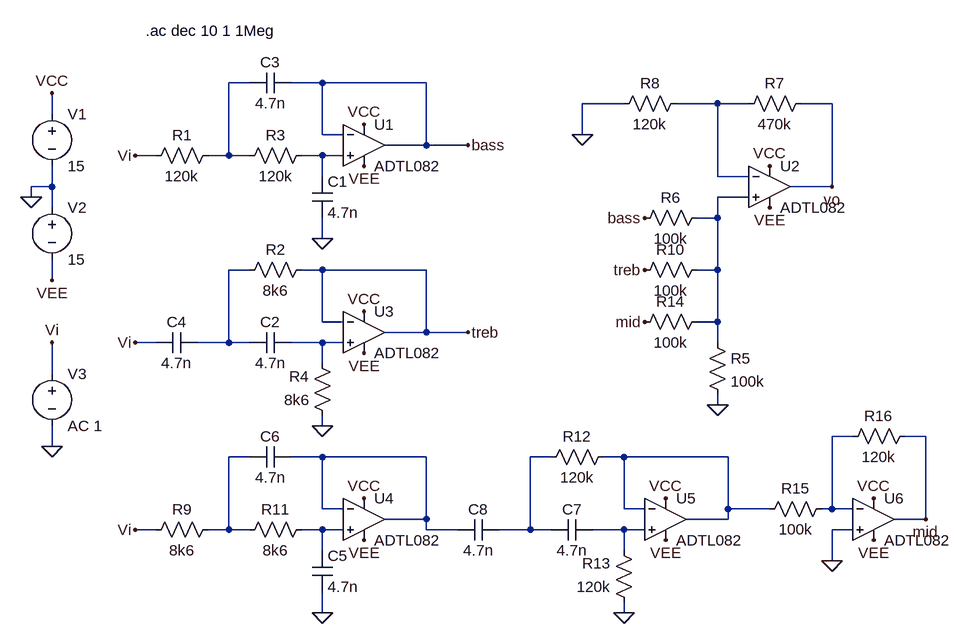
[diagram p0: schematic eq_sk.asc]
eq_sk.asc, the LTspice schematic file:
Version 4.1
SHEET 1 1384 1348
WIRE 192 16 160 16
WIRE 304 16 256 16
WIRE 464 16 304 16
WIRE 768 48 704 48
WIRE 912 48 848 48
WIRE 960 48 912 48
WIRE 1088 48 1040 48
WIRE -112 64 -112 32
WIRE 304 96 304 16
WIRE 336 96 304 96
WIRE 704 96 704 48
WIRE 464 112 464 16
WIRE 464 112 400 112
WIRE 528 112 464 112
WIRE 48 128 16 128
WIRE 160 128 160 16
WIRE 160 128 128 128
WIRE 192 128 160 128
WIRE 304 128 272 128
WIRE 336 128 304 128
WIRE 304 160 304 128
WIRE 912 160 912 48
WIRE 960 160 912 160
WIRE -112 176 -112 144
WIRE -112 176 -144 176
WIRE 1088 176 1088 48
WIRE 1088 176 1024 176
WIRE -144 192 -144 176
WIRE 960 192 912 192
WIRE -112 208 -112 176
WIRE 912 224 912 192
WIRE 912 224 880 224
WIRE 304 256 304 224
WIRE 192 304 160 304
WIRE 304 304 272 304
WIRE 464 304 304 304
WIRE 912 304 912 224
WIRE 912 304 880 304
WIRE -112 320 -112 288
WIRE 304 384 304 304
WIRE 336 384 304 384
WIRE 912 384 912 304
WIRE 912 384 880 384
WIRE 464 400 464 304
WIRE 464 400 400 400
WIRE 528 400 464 400
WIRE 48 416 16 416
WIRE 160 416 160 304
WIRE 160 416 112 416
WIRE 192 416 160 416
WIRE 304 416 256 416
WIRE 336 416 304 416
WIRE 912 416 912 384
WIRE 304 448 304 416
WIRE -112 464 -112 416
WIRE 912 512 912 496
WIRE 304 544 304 528
WIRE 1120 560 1088 560
WIRE 1232 560 1200 560
WIRE -112 576 -112 544
WIRE 192 592 160 592
WIRE 304 592 256 592
WIRE 464 592 304 592
WIRE 656 592 624 592
WIRE 768 592 736 592
WIRE 928 592 768 592
WIRE 304 672 304 592
WIRE 336 672 304 672
WIRE 768 672 768 592
WIRE 800 672 768 672
WIRE 928 672 928 592
WIRE 992 672 928 672
WIRE 1088 672 1088 560
WIRE 1088 672 1072 672
WIRE 1120 672 1088 672
WIRE 464 688 464 592
WIRE 464 688 400 688
WIRE 928 688 928 672
WIRE 928 688 864 688
WIRE 1232 688 1232 560
WIRE 1232 688 1184 688
WIRE 48 704 16 704
WIRE 160 704 160 592
WIRE 160 704 128 704
WIRE 192 704 160 704
WIRE 304 704 272 704
WIRE 336 704 304 704
WIRE 464 704 464 688
WIRE 512 704 464 704
WIRE 624 704 624 592
WIRE 624 704 576 704
WIRE 656 704 624 704
WIRE 768 704 720 704
WIRE 800 704 768 704
WIRE 1120 704 1088 704
WIRE 304 736 304 704
WIRE 768 736 768 704
WIRE 1088 752 1088 704
WIRE 304 832 304 800
WIRE 768 832 768 816
FLAG -112 320 VEE
FLAG -112 32 VCC
FLAG -144 192 0
FLAG -112 576 0
FLAG -112 416 Vi
FLAG 992 144 VCC
FLAG 992 208 VEE
FLAG 912 512 0
FLAG 800 224 bass
FLAG 800 304 treb
FLAG 1088 176 vo
FLAG 1232 688 mid
FLAG 800 384 mid
FLAG 704 96 0
FLAG 1152 656 VCC
FLAG 1152 720 VEE
FLAG 1088 752 0
FLAG 368 80 VCC
FLAG 368 144 VEE
FLAG 304 256 0
FLAG 528 112 bass
FLAG 16 128 Vi
FLAG 368 368 VCC
FLAG 368 432 VEE
FLAG 304 544 0
FLAG 528 400 treb
FLAG 16 416 Vi
FLAG 368 656 VCC
FLAG 368 720 VEE
FLAG 304 832 0
FLAG 16 704 Vi
FLAG 832 656 VCC
FLAG 832 720 VEE
FLAG 768 832 0
SYMBOL voltage -112 48 R0
WINDOW 123 0 0 Left 0
WINDOW 39 0 0 Left 0
SYMATTR InstName V1
SYMATTR Value 15
SYMBOL voltage -112 192 R0
WINDOW 123 0 0 Left 0
WINDOW 39 0 0 Left 0
SYMATTR InstName V2
SYMATTR Value 15
SYMBOL voltage -112 448 R0
WINDOW 123 0 0 Left 0
WINDOW 39 0 0 Left 0
SYMATTR InstName V3
SYMATTR Value AC 1
SYMBOL OpAmps\\ADTL082 992 112 R0
SYMATTR InstName U2
SYMBOL res 896 400 R0
SYMATTR InstName R5
SYMATTR Value 100k
SYMBOL res 896 208 R90
WINDOW 0 0 56 VBottom 2
WINDOW 3 32 56 VTop 2
SYMATTR InstName R6
SYMATTR Value 100k
SYMBOL res 896 288 R90
WINDOW 0 0 56 VBottom 2
WINDOW 3 32 56 VTop 2
SYMATTR InstName R10
SYMATTR Value 100k
SYMBOL res 896 368 R90
WINDOW 0 0 56 VBottom 2
WINDOW 3 32 56 VTop 2
SYMATTR InstName R14
SYMATTR Value 100k
SYMBOL res 1056 32 R90
WINDOW 0 0 56 VBottom 2
WINDOW 3 32 56 VTop 2
SYMATTR InstName R7
SYMATTR Value 470k
SYMBOL res 864 32 R90
WINDOW 0 0 56 VBottom 2
WINDOW 3 32 56 VTop 2
SYMATTR InstName R8
SYMATTR Value 120k
SYMBOL OpAmps\\ADTL082 1152 624 R0
SYMATTR InstName U6
SYMBOL res 1088 656 R90
WINDOW 0 0 56 VBottom 2
WINDOW 3 32 56 VTop 2
SYMATTR InstName R15
SYMATTR Value 100k
SYMBOL res 1216 544 R90
WINDOW 0 0 56 VBottom 2
WINDOW 3 32 56 VTop 2
SYMATTR InstName R16
SYMATTR Value 120k
SYMBOL OpAmps\\ADTL082 368 48 R0
SYMATTR InstName U1
SYMBOL res 144 112 R90
WINDOW 0 0 56 VBottom 2
WINDOW 3 32 56 VTop 2
SYMATTR InstName R1
SYMATTR Value 120k
SYMBOL res 288 112 R90
WINDOW 0 0 56 VBottom 2
WINDOW 3 32 56 VTop 2
SYMATTR InstName R3
SYMATTR Value 120k
SYMBOL cap 288 160 R0
SYMATTR InstName C1
SYMATTR Value 4.7n
SYMBOL cap 256 0 R90
WINDOW 0 0 32 VBottom 2
WINDOW 3 32 32 VTop 2
SYMATTR InstName C3
SYMATTR Value 4.7n
SYMBOL OpAmps\\ADTL082 368 336 R0
SYMATTR InstName U3
SYMBOL res 288 288 R90
WINDOW 0 0 56 VBottom 2
WINDOW 3 32 56 VTop 2
SYMATTR InstName R2
SYMATTR Value 8k6
SYMBOL res 320 544 R180
WINDOW 0 36 76 Left 2
WINDOW 3 36 40 Left 2
SYMATTR InstName R4
SYMATTR Value 8k6
SYMBOL cap 256 400 R90
WINDOW 0 0 32 VBottom 2
WINDOW 3 32 32 VTop 2
SYMATTR InstName C2
SYMATTR Value 4.7n
SYMBOL cap 112 400 R90
WINDOW 0 0 32 VBottom 2
WINDOW 3 32 32 VTop 2
SYMATTR InstName C4
SYMATTR Value 4.7n
SYMBOL OpAmps\\ADTL082 368 624 R0
SYMATTR InstName U4
SYMBOL res 144 688 R90
WINDOW 0 0 56 VBottom 2
WINDOW 3 32 56 VTop 2
SYMATTR InstName R9
SYMATTR Value 8k6
SYMBOL res 288 688 R90
WINDOW 0 0 56 VBottom 2
WINDOW 3 32 56 VTop 2
SYMATTR InstName R11
SYMATTR Value 8k6
SYMBOL cap 288 736 R0
SYMATTR InstName C5
SYMATTR Value 4.7n
SYMBOL cap 256 576 R90
WINDOW 0 0 32 VBottom 2
WINDOW 3 32 32 VTop 2
SYMATTR InstName C6
SYMATTR Value 4.7n
SYMBOL OpAmps\\ADTL082 832 624 R0
SYMATTR InstName U5
SYMBOL res 752 576 R90
WINDOW 0 0 56 VBottom 2
WINDOW 3 32 56 VTop 2
SYMATTR InstName R12
SYMATTR Value 120k
SYMBOL res 784 832 R180
WINDOW 0 36 76 Left 2
WINDOW 3 36 40 Left 2
SYMATTR InstName R13
SYMATTR Value 120k
SYMBOL cap 720 688 R90
WINDOW 0 0 32 VBottom 2
WINDOW 3 32 32 VTop 2
SYMATTR InstName C7
SYMATTR Value 4.7n
SYMBOL cap 576 688 R90
WINDOW 0 0 32 VBottom 2
WINDOW 3 32 32 VTop 2
SYMATTR InstName C8
SYMATTR Value 4.7n
TEXT 32 -64 Left 2 !.ac dec 10 1 1Meg

The netlist it stands for:
* eq_sk.asc
V1 VCC 0 15
V2 0 VEE 15
V3 Vi 0 AC 1
X§U2 N004 N002 VCC VEE vo ADTL082  ; pins In+ In- V+ V- OUT
R5 N004 0 100k
R6 N004 bass 100k
R10 N004 treb 100k
R14 N004 mid 100k
R7 vo N002 470k
R8 N002 0 120k
X§U6 0 N007 VCC VEE mid ADTL082  ; pins In+ In- V+ V- OUT
R15 N007 N011 100k
R16 mid N007 120k
X§U1 N003 bass VCC VEE bass ADTL082  ; pins In+ In- V+ V- OUT
R1 N001 Vi 120k
R3 N003 N001 120k
C1 N003 0 4.7n
C3 bass N001 4.7n
X§U3 N006 treb VCC VEE treb ADTL082  ; pins In+ In- V+ V- OUT
R2 treb N005 8k6
R4 0 N006 8k6
C2 N006 N005 4.7n
C4 N005 Vi 4.7n
X§U4 N012 N009 VCC VEE N009 ADTL082  ; pins In+ In- V+ V- OUT
R9 N008 Vi 8k6
R11 N012 N008 8k6
C5 N012 0 4.7n
C6 N009 N008 4.7n
X§U5 N013 N011 VCC VEE N011 ADTL082  ; pins In+ In- V+ V- OUT
R12 N011 N010 120k
R13 0 N013 120k
C7 N013 N010 4.7n
C8 N010 N009 4.7n
.ac dec 10 1 1Meg
.lib ADI.lib
.backanno
.end